# Altium schematic sheet LCD_power_supplies.SchDoc
size A3; SheetNumber: 3; SheetTotal: 3; SPICEModelCacheFLKPPTFO: <root> / <DocumentId>FLKPPTFO</DocumentId> / <CacheFrame Number="0"> / <Model Name="skydiode" Kind="MDL"> / <Text>*Default Schottky Diode / *Schottky Diode Pinout: A,K / .MODEL SKYDIODE D(EG=0.69 XTI=2)</Text> / </Model> / </CacheFrame> / </root>
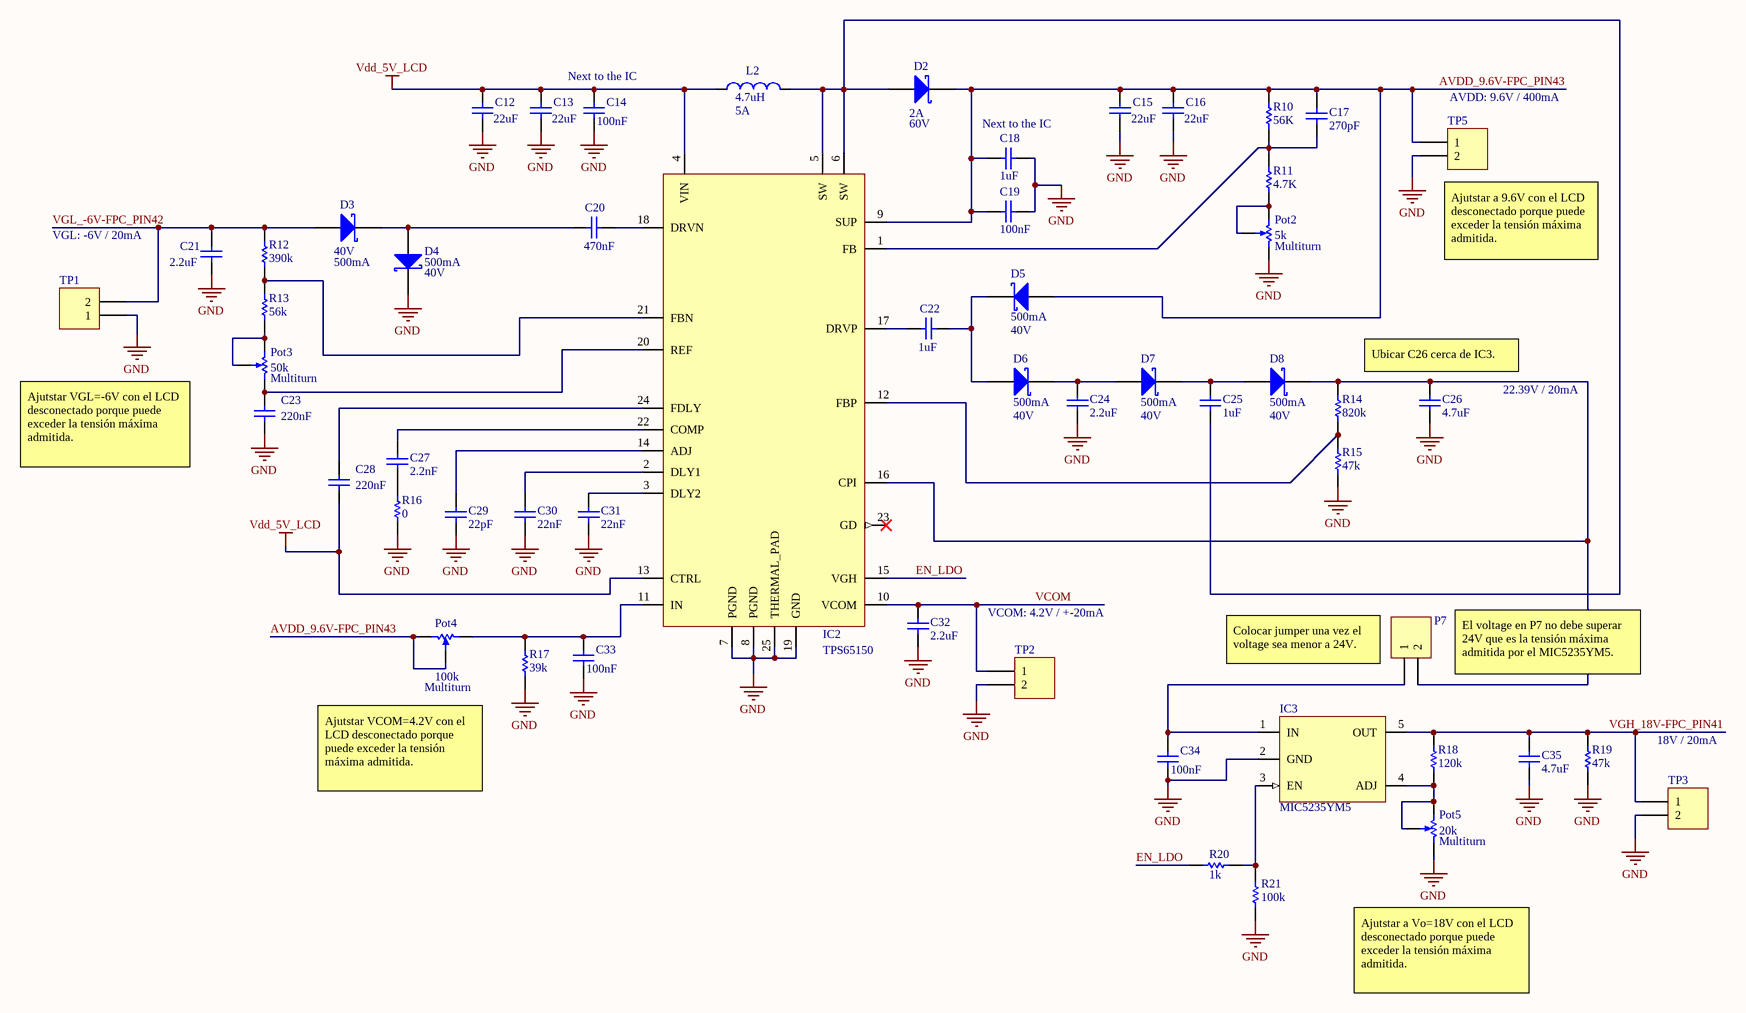
[diagram p0: LCD_power_supplies.SchDoc]

## Parts
C12  value 22uF  [capacitor 0805]  (hidden comment: ceramic capacitor)
C13  value 22uF  [capacitor 0805]  (hidden comment: ceramic capacitor)
C14  value 100nF  [capacitor 0805]  (hidden comment: ceramic capacitor)
C15  value 22uF  [capacitor 0805]  (hidden comment: ceramic capacitor)
C16  value 22uF  [capacitor 0805]  (hidden comment: ceramic capacitor)
C17  value 270pF  [capacitor 0603]  (hidden comment: ceramic capacitor)
C18  value 1uF  [capacitor 0603]  (hidden comment: ceramic capacitor)
C19  value 100nF  [capacitor 0603]  (hidden comment: ceramic capacitor)
C20  value 470nF  [capacitor 0603]  (hidden comment: ceramic capacitor)
C21  value 2.2uF  [capacitor 0603]  (hidden comment: ceramic capacitor)
C22  value 1uF  [capacitor 0805]  (hidden comment: ceramic capacitor)
C23  value 220nF  [capacitor 0805]  (hidden comment: ceramic capacitor)
C24  value 2.2uF  [capacitor 0805]  (hidden comment: ceramic capacitor)
C25  value 1uF  [capacitor 0805]  (hidden comment: ceramic capacitor)
C26  value 4.7uF  [capacitor 1206]  (hidden comment: ceramic capacitor)
C27  value 2.2nF  [capacitor 0603]  (hidden comment: ceramic capacitor)
C28  value 220nF  [capacitor 0805]  (hidden comment: ceramic capacitor)
C29  value 22pF  [capacitor 0603]  (hidden comment: ceramic capacitor)
C30  value 22nF  [capacitor 0603]  (hidden comment: ceramic capacitor)
C31  value 22nF  [capacitor 0603]  (hidden comment: ceramic capacitor)
C32  value 2.2uF  [capacitor 0603]  (hidden comment: ceramic capacitor)
C33  value 100nF  [capacitor 0603]  (hidden comment: ceramic capacitor)
C34  value 100nF  [capacitor 0603]  (hidden comment: ceramic capacitor)
C35  value 4.7uF  [capacitor 1206]  (hidden comment: ceramic capacitor)
D2  current: 2A  voltage: 60V  [DO-214AC]  (hidden comment: D Schottky)
D3  current: 500mA  voltage: 40V  [SOD123]  (hidden comment: D Schottky)
D4  current: 500mA  voltage: 40V  [SOD123]  (hidden comment: D Schottky)
D5  current: 500mA  voltage: 40V  [SOD123]  (hidden comment: D Schottky)
D6  current: 500mA  voltage: 40V  [SOD123]  (hidden comment: D Schottky)
D7  current: 500mA  voltage: 40V  [SOD123]  (hidden comment: D Schottky)
D8  current: 500mA  voltage: 40V  [SOD123]  (hidden comment: D Schottky)
IC2  TPS65150  [TSSOP24-Thermal_pad]
IC3  MIC5235YM5  [sot-23 (5)]
L2  value 4.7uH  Irms: 5A  [Inductor SMD 6.6 x 7.1 x 3]  (hidden comment: Inductor)
P7  Header 2  [HDR1X2]  (value not drawn)
Pot2  Multiturn  value 5k  [trim pot 3296W]
Pot3  Multiturn  value 50k  [trim pot 3296W]
Pot4  Multiturn  value 100k  [trim pot 3296W]
Pot5  Multiturn  value 20k  [trim pot 3296W]
R10  value 56K  [resistor 0603]  (hidden comment: Resistor)
R11  value 4.7K  [resistor 0603]  (hidden comment: Resistor)
R12  value 390k  [resistor 0603]  (hidden comment: Resistor)
R13  value 56k  [resistor 0603]  (hidden comment: Resistor)
R14  value 820k  [resistor 0603]  (hidden comment: Resistor)
R15  value 47k  [resistor 0603]  (hidden comment: Resistor)
R16  value 0  [resistor 0603]  (hidden comment: Resistor)
R17  value 39k  [resistor 0603]  (hidden comment: Resistor)
R18  value 120k  [resistor 0603]  (hidden comment: Resistor)
R19  value 47k  [resistor 0603]  (hidden comment: Resistor)
R20  value 1k  [resistor 0603]  (hidden comment: Resistor)
R21  value 100k  [resistor 0603]  (hidden comment: Resistor)
TP1  Header 2  [HDR1X2]  (value not drawn)
TP2  Header 2  [HDR1X2]  (value not drawn)
TP3  Header 2  [HDR1X2]  (value not drawn)
TP5  Header 2  [HDR1X2]  (value not drawn)

## Nets
GND: C12.2 C13.2 C14.2 C15.2 C16.2 C18.2 C19.2 C21.2 C23.2 C24.1 C26.1 C29.2 C30.1 C31.1 C32.1 C33.2 C34.2 C35.1 D4.2(K) IC2.7(PGND) IC2.8(PGND) IC2.19(GND) IC2.25(THERMAL_PAD) IC3.2(GND) Pot2.CCW(-) Pot5.CCW(-) R15.2 R16.2 R17.1 R19.1 R21.1 TP1.1 TP2.2 TP3.2 TP5.2
Vdd_5V_LCD: C12.1 C13.1 C14.1 C28.2 IC2.4(VIN) IC2.13(CTRL) L2.1
AVDD_9.6V-FPC_PIN43: C15.1 C16.1 C17.2 C18.1 C19.1 D2.2(K) D5.1(A) IC2.9(SUP) Pot4.CW(+) Pot4.W R10.1 TP5.1
EN_LDO: IC2.15(VGH) R20.1
VCOM: C32.2 IC2.10(VCOM) TP2.1
VGH_18V-FPC_PIN41: C35.2 IC3.5(OUT) R18.2 R19.2 TP3.1
VGL_-6V-FPC_PIN42: C21.1 D3.1(A) R12.1 TP1.2
NetC17_1: C17.1 IC2.1(FB) R10.2 R11.1
NetC20_1: C20.1 IC2.18(DRVN)
NetC20_2: C20.2 D3.2(K) D4.1(A)
NetC22_1: C22.1 D5.2(K) D6.1(A)
NetC22_2: C22.2 IC2.17(DRVP)
NetC23_1: C23.1 IC2.20(REF) Pot3.CCW(-)
NetC24_2: C24.2 D6.2(K) D7.1(A)
NetC25_1: C25.1 D7.2(K) D8.1(A)
NetC25_2: C25.2 D2.1(A) IC2.5(SW) IC2.6(SW) L2.2
NetC26_2: C26.2 D8.2(K) IC2.16(CPI) P7.2 R14.1
NetC27_1: C27.1 IC2.22(COMP)
NetC27_2: C27.2 R16.1
NetC28_1: C28.1 IC2.24(FDLY)
NetC29_1: C29.1 IC2.14(ADJ)
NetC30_2: C30.2 IC2.2(DLY1)
NetC31_2: C31.2 IC2.3(DLY2)
NetC33_1: C33.1 IC2.11(IN) Pot4.CCW(-) R17.2
NetC34_1: C34.1 IC3.1(IN) P7.1
NetIC2_12: IC2.12(FBP) R14.2 R15.1
NetIC2_21: IC2.21(FBN) R12.2 R13.1
NetIC3_3: IC3.3(EN) R20.2 R21.2
NetIC3_4: IC3.4(ADJ) Pot5.CW(+) Pot5.W R18.1
NetPot2_CW: Pot2.CW(+) Pot2.W R11.2
NetPot3_CW: Pot3.CW(+) Pot3.W R13.2

Not connected (* = marked no-connect by the designer): IC2 23(GD)*

## Notes on the sheet
- (near C14) Next to the IC
- (near TP5) AVDD: 9.6V / 400mA
- (near C18) Next to the IC
- VGL: -6V / 20mA
- (near TP5) Ajutstar a 9.6V con el LCD desconectado porque puede exceder la tensión máxima admitida.
- Ubicar C26 cerca de IC3.
- 22.39V / 20mA
- Ajutstar VGL=-6V con el LCD desconectado porque puede exceder la tensión máxima admitida.
- VCOM: 4.2V / +-20mA
- (near P7) Colocar jumper una vez el voltage sea menor a 24V.
- (near P7) El voltage en P7 no debe superar 24V que es la tensión máxima admitida por el MIC5235YM5.
- Ajutstar VCOM=4.2V con el LCD desconectado porque puede exceder la tensión máxima admitida.
- 18V / 20mA
- Ajutstar a Vo=18V con el LCD desconectado porque puede exceder la tensión máxima admitida.

## Library data of the parts
C12 C13 C15 C16 = ceramic capacitor: Multilayer ceramic capacitor; V: 25; Material: X5R; LCSC part: C602037; Package: 0805
C14 C19 C33 C34 = ceramic capacitor: Multilayer ceramic capacitor; V: 50; Material: X7R
  C14: LCSC part: C1711; Package: 0805
  C19 C33 C34: LCSC part: C1591; Package: 0603
C17 C27 C29 = ceramic capacitor: Multilayer ceramic capacitor; V: 50V; Material: C0G; Package: 0603
  C17: LCSC part: C472789
  C27: LCSC part: C343869
  C29: LCSC part: C1653
C18 = ceramic capacitor: Multilayer ceramic capacitor; V: 25; Material: X7R; LCSC part: C29936; Package: 0603
C20 C23 C28 = ceramic capacitor: Multilayer ceramic capacitor; V: 25V; Material: X7R
  C20: LCSC part: C472773; Package: 0603
  C23 C28: LCSC part: C5153; Package: 0805
C21 C32 = ceramic capacitor: Multilayer ceramic capacitor; V: 25V; Material: X5R; LCSC part: C57895; Package: 0603
C22 C24-C26 C30 C31 C35 = ceramic capacitor: Multilayer ceramic capacitor; V: 50V; Material: X7R
  C22 C25: LCSC part: C77083; Package: 0805
  C24: LCSC part: C2762602; Package: 0805
  C26 C35: LCSC part: C307575; Package: 1206
  C30 C31: LCSC part: C21122; Package: 0603
D2 = D Schottky: Schottky Diode; MFR: Vishay Intertech; MFR part: SS26SHE3_B/H; LCSC part: C511359; Package: SMA(DO-214AC)
D3-D8 = D Schottky: Schottky Diode; MFR: onsemi; MFR part: MBR0540T1G; LCSC part: C21353; Package: SOD-123
IC2 = TPS65150: LCD Power Supply
IC3 = MIC5235YM5: Ultra-Low Quiescent Current, 150mA μCap LDO Regulator.
L2 = Inductor: MFR: Magnetsyc; MFR part: FSA0630-4R7MT; Isat: 7.2A; Max. DC Resistance: 33mOhm; LCSC part: C41384284; Package: SMD,7x6.6mm
P7 TP1-TP3 TP5 = Header 2: Header, 2-Pin; LatestRevisionDate: 17-Jul-2002; LatestRevisionNote: Re-released for DXP Platform.; Publisher: Altium Limited
Pot2-Pot5 = RPot SM: Square Trimming Potentiometer; pin to pad: CCW>1 CW>2 W>3; ComponentLink1Description: Manufacturer Link; ComponentLink1URL: http://bourns.com/2/search.html
R10-R21 = Resistor: Package: 0603